# EasyEDA Pro project ProPrj_PWR-1_2025-04-17.epro

# Schematic Schematic_1

## Sheets
1 P1: Board Name: Board_1; Create Date: 2025-04-08; Page Name: P1; Project Name: PWR-1; Schematic Name: Schematic_1; Update Date: 2025-04-08; Company: EasyEDA.com; Drawed: EasyEDA Pro; Page Size: A3; Part Number: JLCPCB-001; Reviewed: EasyEDA Pro; Version: V0.1
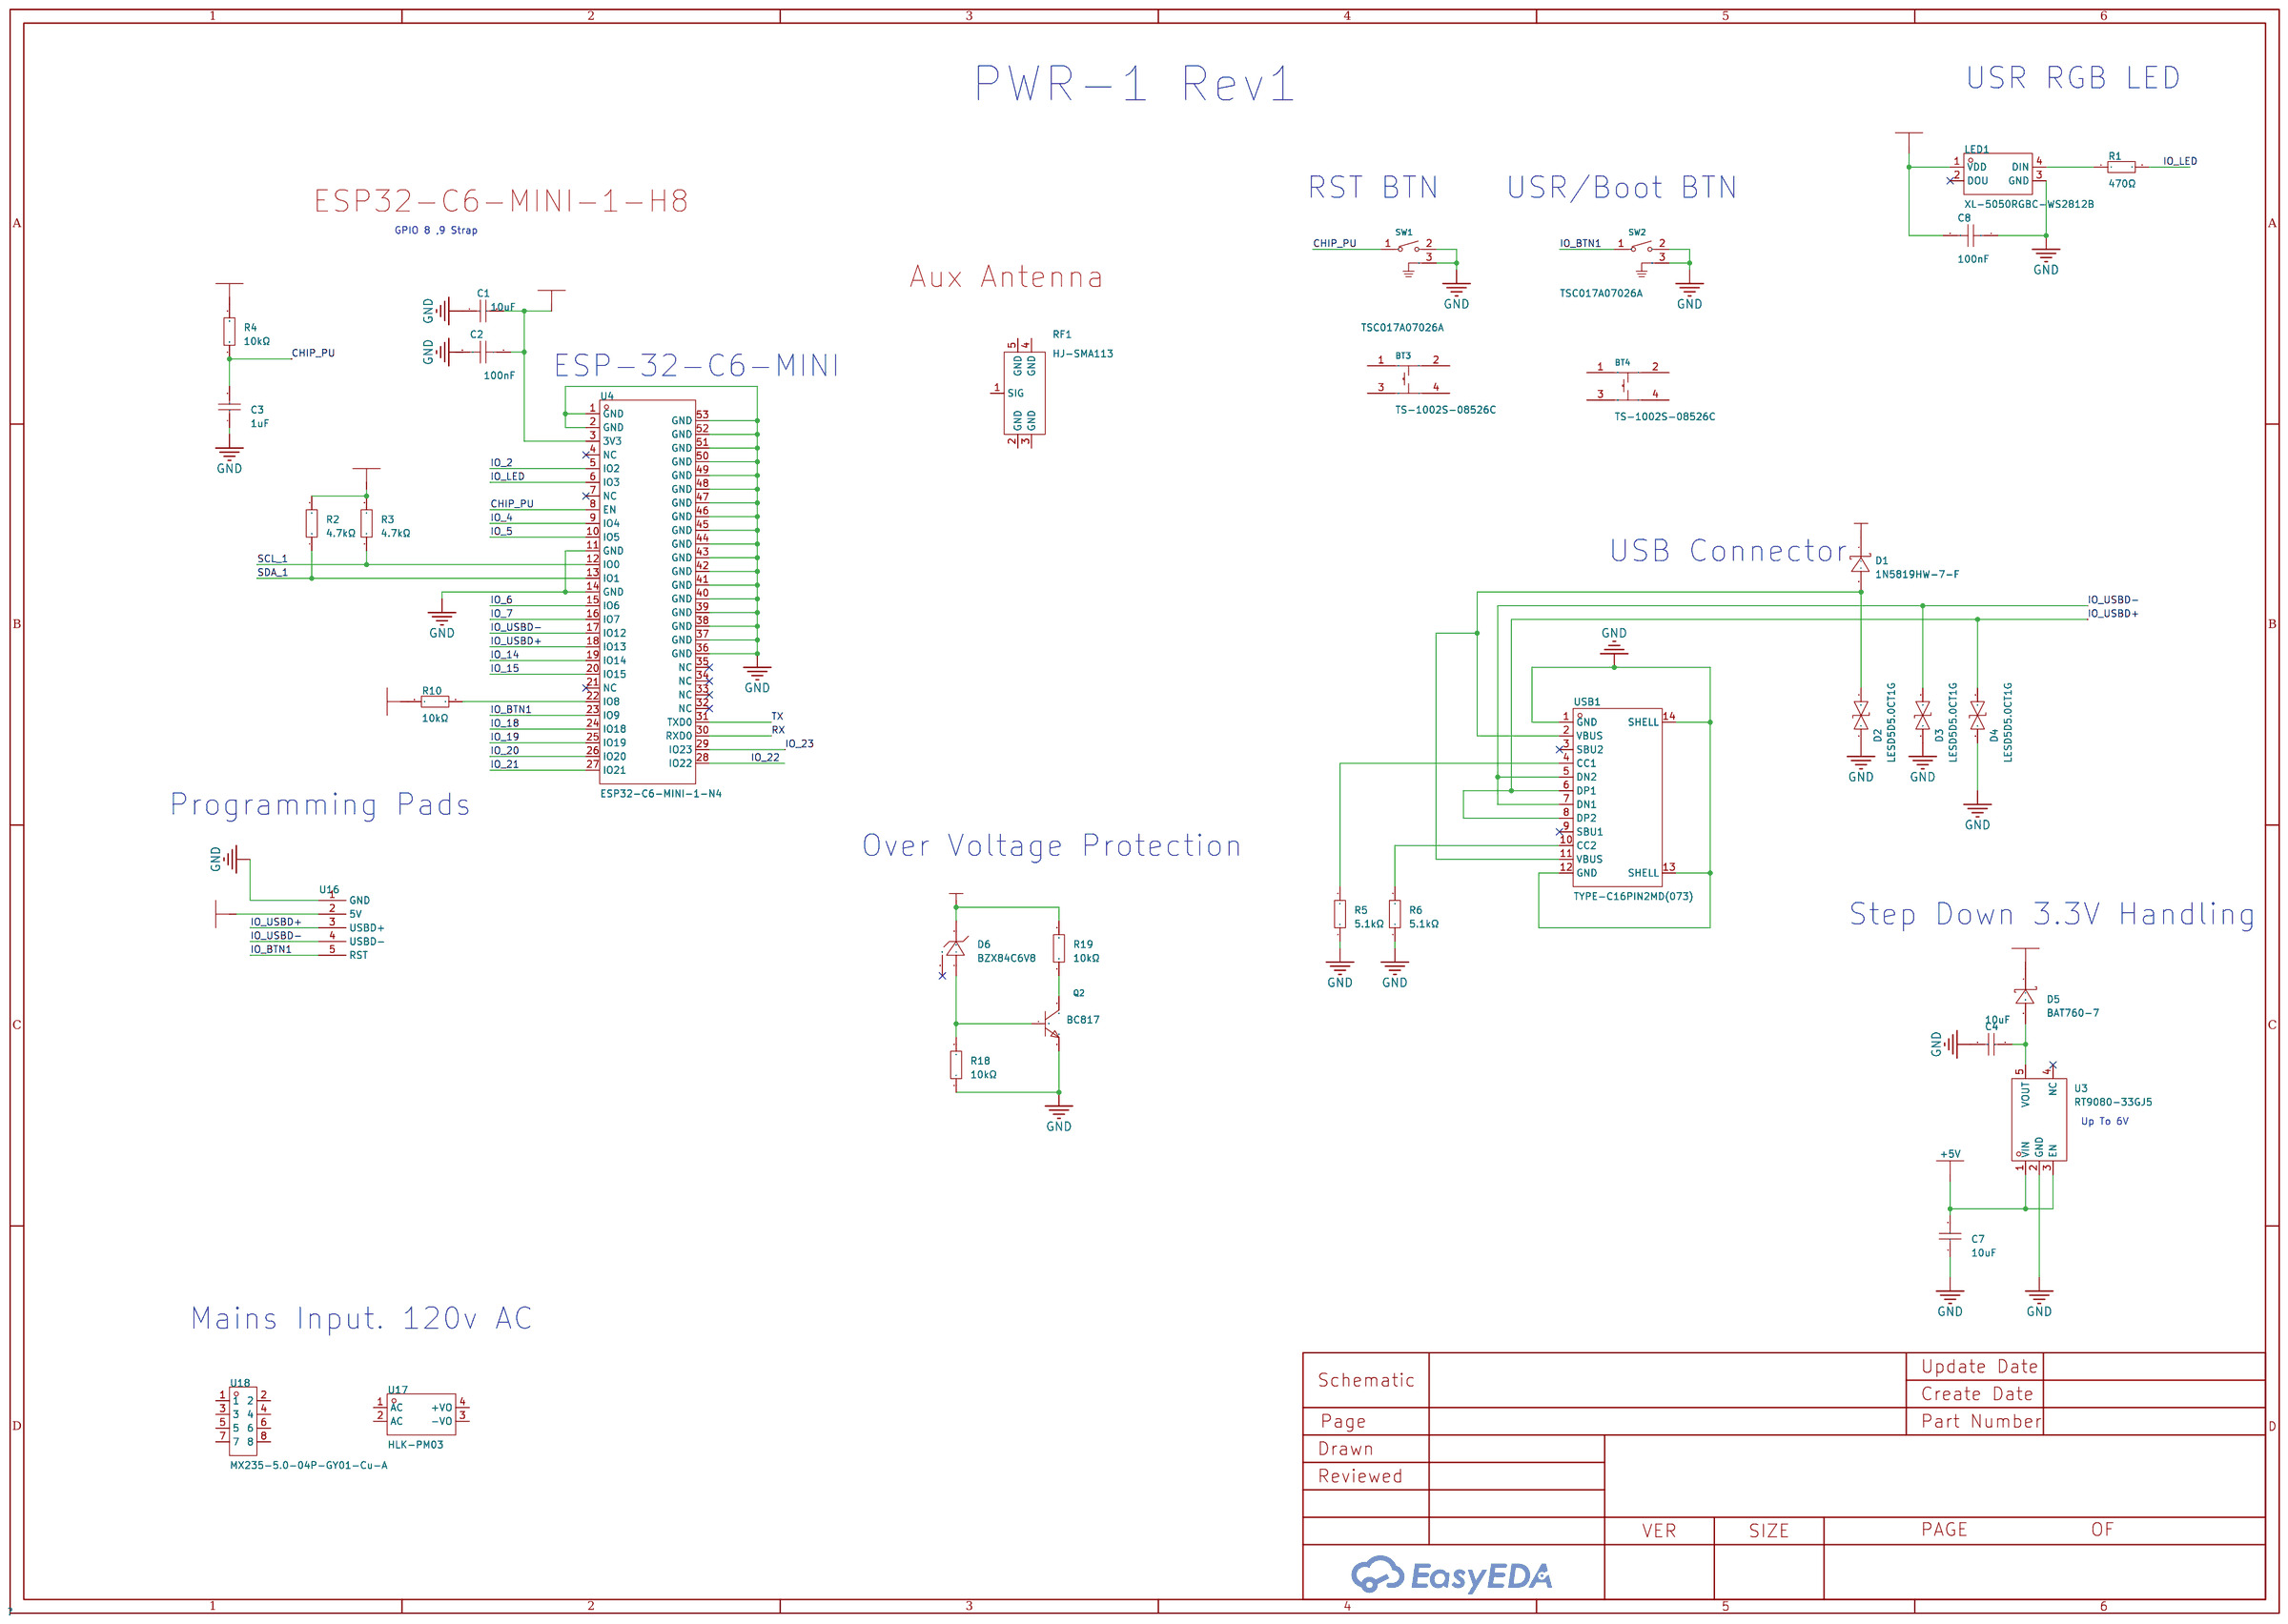
[diagram p0: P1]
2 P2: Page Name: P2
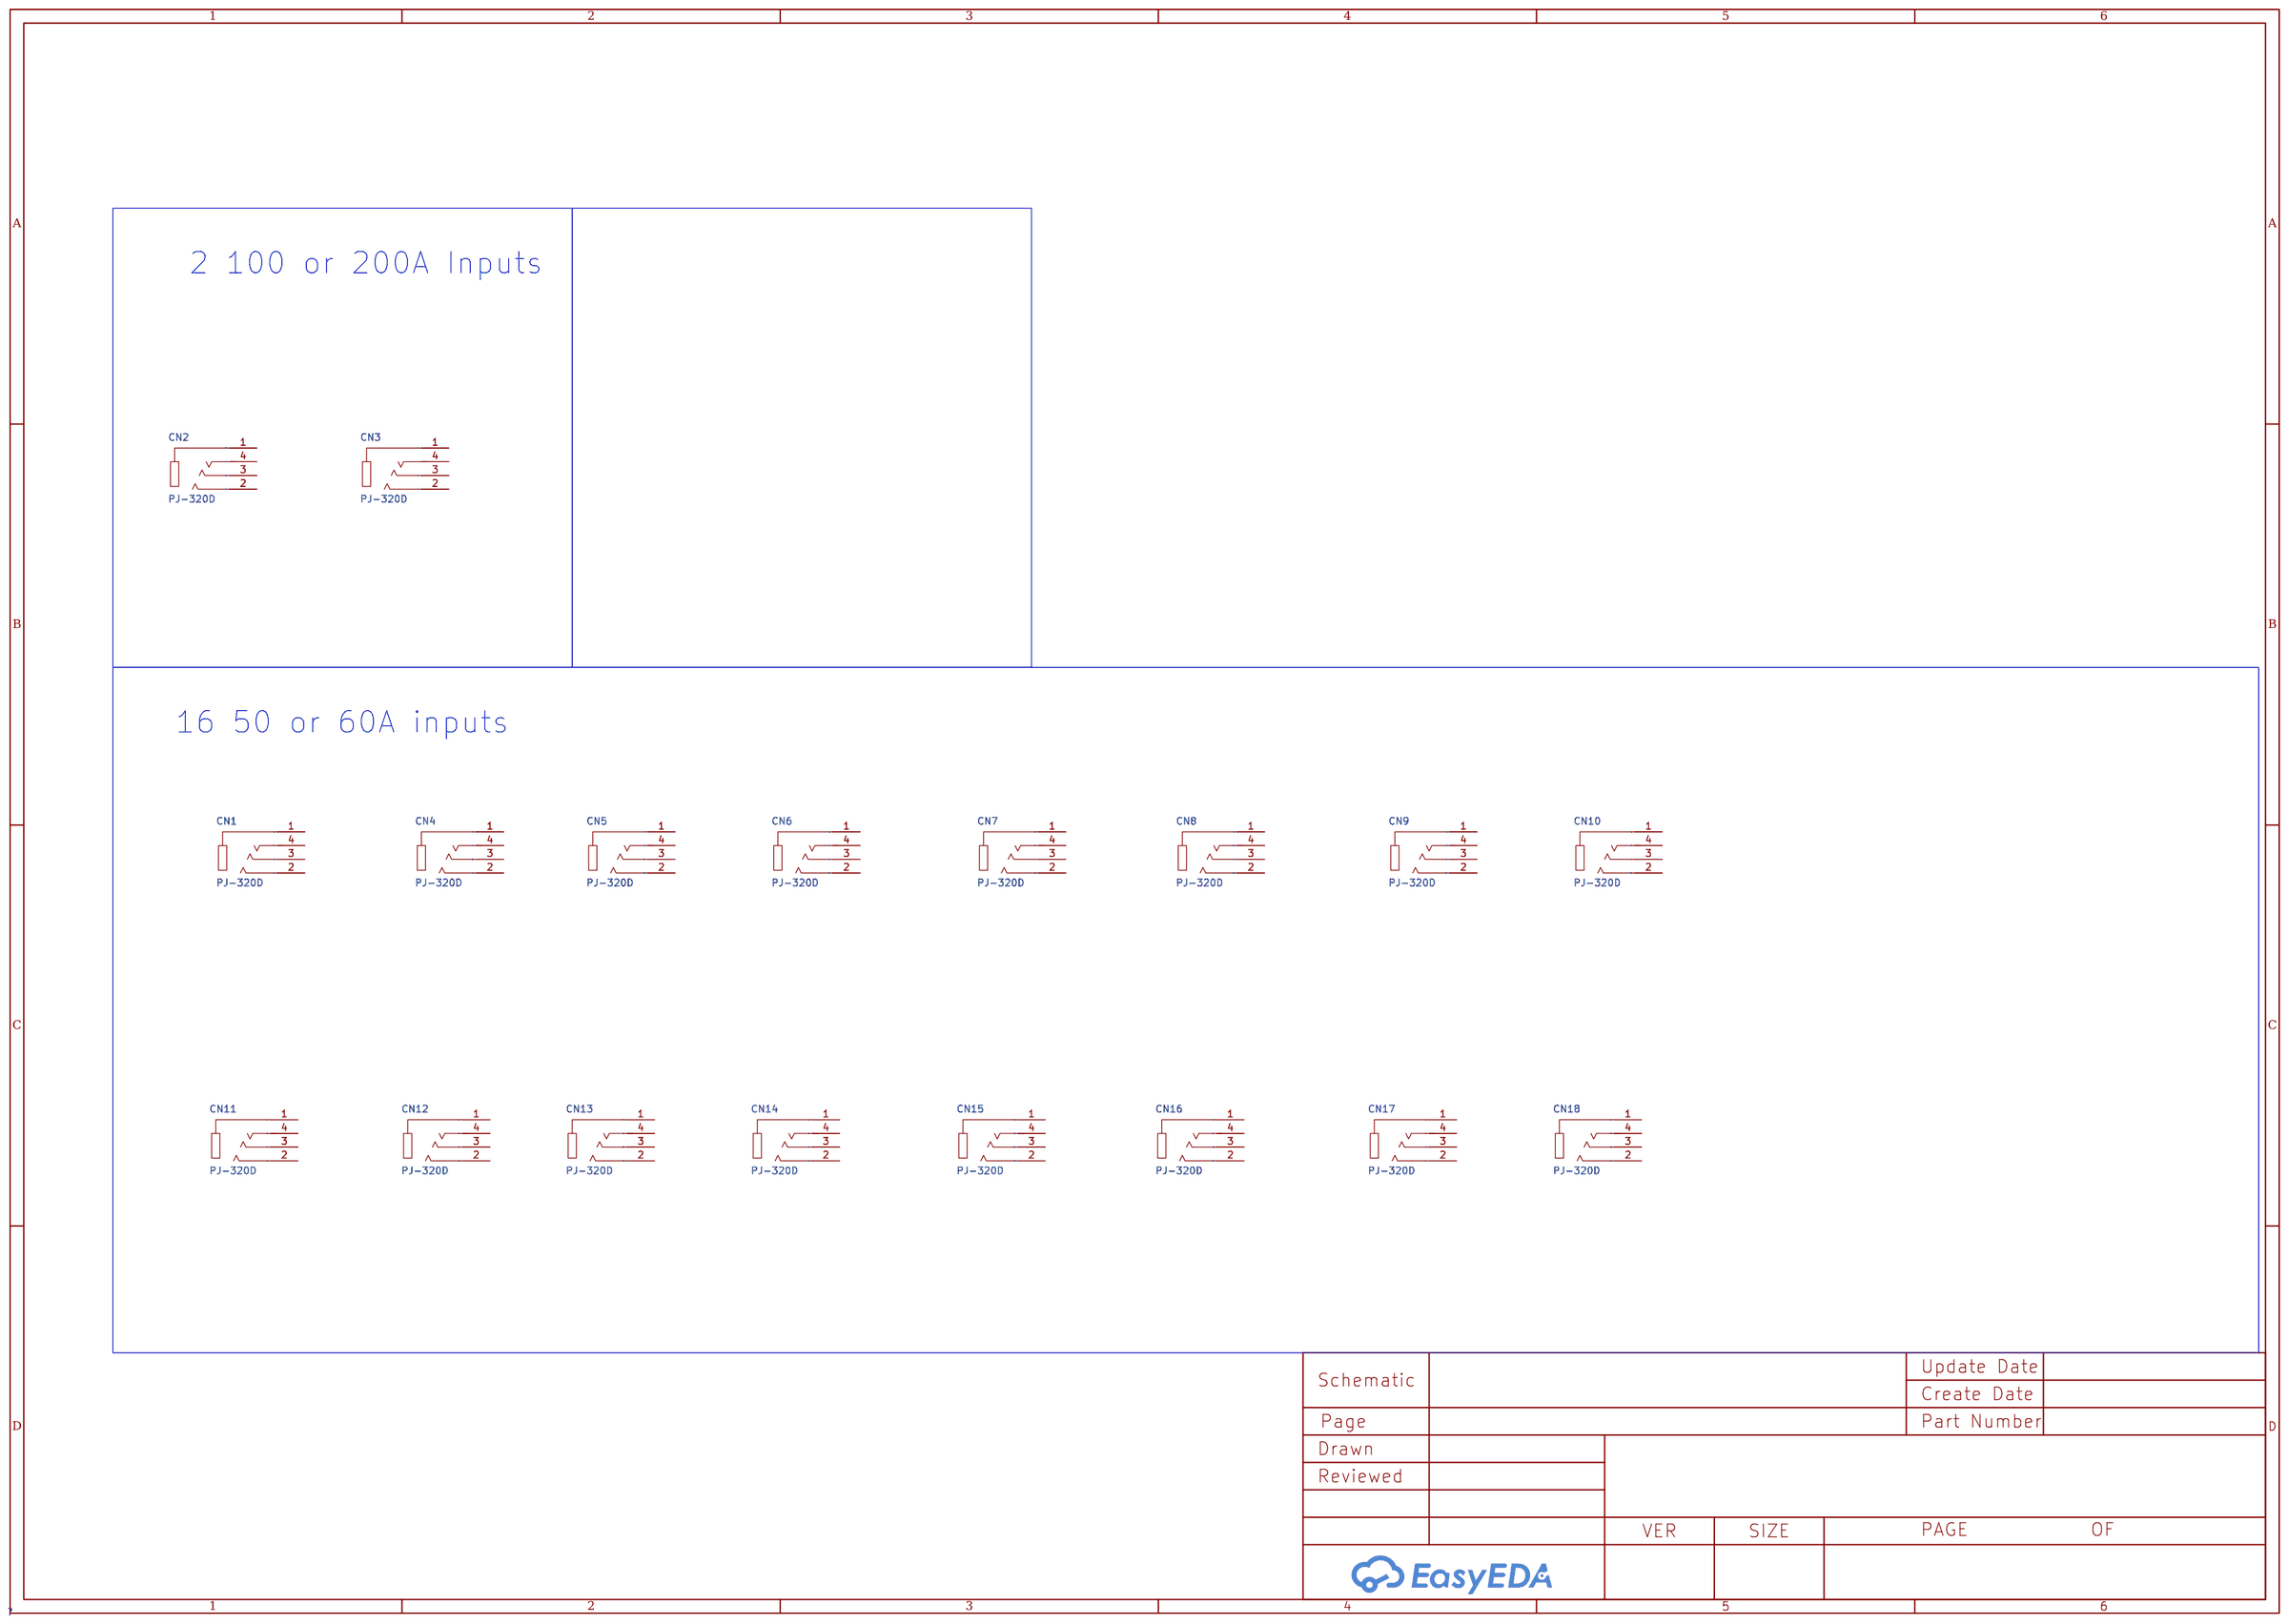
[diagram p1: P2]

## Parts
sheet P1
BT3  TS-1002S-08526C  [KEY-SMD_4P-L6.0-W6.0-P4.50-LS9.5-BR]
BT4  TS-1002S-08526C  [KEY-SMD_4P-L6.0-W6.0-P4.50-LS9.5-BR]
C1  10uF  [C0402]
C2  100nF  [C0402]
C3  1uF  [C0402]
C4  10uF  [C0402]
C7  10uF  [C0402]
C8  100nF  [C0402]
D1  1N5819HW-7-F  [SOD-123_L2.7-W1.6-LS3.7-RD]
D2  LESD5D5.0CT1G  [SOD-523_L1.2-W0.8-LS1.6-BI]
D3  LESD5D5.0CT1G  [SOD-523_L1.2-W0.8-LS1.6-BI]
D4  LESD5D5.0CT1G  [SOD-523_L1.2-W0.8-LS1.6-BI]
D5  BAT760-7  [SOD-323_L1.8-W1.3-LS2.5-RD]
D6  BZX84C6V8  [SOT-23_L2.9-W1.3-P1.90-LS2.4-BR]
LED1  XL-5050RGBC-WS2812B  [LED-SMD_4P-L5.0-W5.0-BL_XL-5050RGBC]
Q2  BC817  [SOT-23-3_L2.9-W1.4-P1.91-LS2.6-BR]
R1  470Ω  [R0402]
R2  4.7kΩ  [R0402]
R3  4.7kΩ  [R0402]
R4  10kΩ  [R0402]
R5  5.1kΩ  [R0402]
R6  5.1kΩ  [R0402]
R10  10kΩ  [R0402]
R18  10kΩ  [R0603]
R19  10kΩ  [R0603]
RF1  HJ-SMA113  [SMA-TH_HJ-SMA113]
SW1  TSC017A07026A  [SW-TH_3P-L4.5-W7.0-P3.00-LS1.9]
SW2  TSC017A07026A  [SW-TH_3P-L4.5-W7.0-P3.00-LS1.9]
U3  RT9080-33GJ5  [TSOT-23-5_L2.9-W1.6-P0.95-LS2.8-BL]
U4  ESP32-C6-MINI-1-N4  [WIFIM-SMD_61P-L16.6-W13.2-P0.80-ESP32-C6-MINI-1-N4]
U16  -  [Programming Pads]
U17  HLK-PM03  [PWRM-TH_HLK-PM03]
U18  MX235-5.0-04P-GY01-Cu-A  [CONN-TH_8P-P5.00_MAX_MX235-5.0-GY01-04P-CU-A]
USB1  TYPE-C16PIN2MD(073)  [USB-C-SMD_TYPE-C-6PIN-2MD-073]
sheet P2
CN1  PJ-320D  [AUDIO-SMD_PJ-320D]
CN2  PJ-320D  [AUDIO-SMD_PJ-320D]
CN3  PJ-320D  [AUDIO-SMD_PJ-320D]
CN4  PJ-320D  [AUDIO-SMD_PJ-320D]
CN5  PJ-320D  [AUDIO-SMD_PJ-320D]
CN6  PJ-320D  [AUDIO-SMD_PJ-320D]
CN7  PJ-320D  [AUDIO-SMD_PJ-320D]
CN8  PJ-320D  [AUDIO-SMD_PJ-320D]
CN9  PJ-320D  [AUDIO-SMD_PJ-320D]
CN10  PJ-320D  [AUDIO-SMD_PJ-320D]
CN11  PJ-320D  [AUDIO-SMD_PJ-320D]
CN12  PJ-320D  [AUDIO-SMD_PJ-320D]
CN13  PJ-320D  [AUDIO-SMD_PJ-320D]
CN14  PJ-320D  [AUDIO-SMD_PJ-320D]
CN15  PJ-320D  [AUDIO-SMD_PJ-320D]
CN16  PJ-320D  [AUDIO-SMD_PJ-320D]
CN17  PJ-320D  [AUDIO-SMD_PJ-320D]
CN18  PJ-320D  [AUDIO-SMD_PJ-320D]

## Library data of the parts
BT3 BT4 = TS-1002S-08526C: Circuit:SPST Actuator Style:Round Button Mounting Style:Brick nogging Switch Length:6mm Switch Width:6mm Switch Height:8.5mm Contact Current:50mA Voltage Rating (DC):12V With Lamp:- Mechanical Life:-; LCSC Part Name: 6*6*8.5mm 立贴 轻触开关; Supplier Part: C455117; Manufacturer: XUNPU(讯普); Supplier Footprint: SMD,6x6mm; Datasheet: https://atta.szlcsc.com/upload/public/pdf/source/20191118/C455126_F61E8FA1ED640FB1CE0B30B55DEB62E3.pdf; Supplier: LCSC; Circuit: SPST; Actuator Style: Round Button; Mounting Style: Brick nogging; Switch Length: 6mm; Switch Width: 6mm; Switch Height: 8.5mm; Contact Current: 50mA; Voltage Rating (DC): 12V
C1 C4 = CL05A106MQ5NUNC: Capacitance: Tolerance:±20% Tolerance:±20% Voltage Rated: Temperature Coefficient:; LCSC Part Name: 10uF ±20% 6.3V; Supplier Part: C15525; Manufacturer: SAMSUNG(三星); Supplier Footprint: 0402; JLCPCB Part Class: Basic Part; Datasheet: https://atta.szlcsc.com/upload/public/pdf/source/20220823/2B02EE04F8F211D38A52DCB16EB6BEBA.pdf; Supplier: LCSC; Tolerance: ±20%
C2 C8 = CL05B104KO5NNNC: Capacitance: Tolerance:±10% Tolerance:±10% Voltage Rated: Temperature Coefficient:; LCSC Part Name: 100nF ±10% 16V; Supplier Part: C1525; Manufacturer: SAMSUNG(三星); Supplier Footprint: 0402; JLCPCB Part Class: Basic Part; Datasheet: https://atta.szlcsc.com/upload/public/pdf/source/20160218/1457707763339.pdf; Supplier: LCSC; Tolerance: ±10%
C3 = CL05A105KP5NNNC: Capacitance: Tolerance:±10% Tolerance:±10% Voltage Rated: Temperature Coefficient:; LCSC Part Name: 1uF ±10% 10V; Supplier Part: C14445; Manufacturer: SAMSUNG(三星); Supplier Footprint: 0402; JLCPCB Part Class: Extended Part; Datasheet: https://atta.szlcsc.com/upload/public/pdf/source/20160218/1457707763339.pdf; Supplier: LCSC; Tolerance: ±10%
C7 = CL05A106MP5NUNC_C315248: Capacitance: Tolerance:±20% Tolerance:±20% Voltage Rated: Temperature Coefficient:; LCSC Part Name: 10uF ±20% 10V; Supplier Part: C315248; Manufacturer: SAMSUNG(三星); Manufacturer Part: CL05A106MP5NUNC; Supplier Footprint: 0402; JLCPCB Part Class: Extended Part; Datasheet: https://atta.szlcsc.com/upload/public/pdf/source/20160218/1457707763339.pdf; Supplier: LCSC; Tolerance: ±20%
D1 = 1N5819HW-7-F: Reverse Voltage (Vr):40V Average Rectified Current (Io):1A Forward Voltage (Vf@If):450mV@1A; LCSC Part Name: 40V1A450mV@1A; Supplier Part: C82544; Manufacturer: DIODES(美台); Supplier Footprint: SOD-123; JLCPCB Part Class: ExtendedPart; Datasheet: https://atta.szlcsc.com/upload/public/pdf/source/20161024/1477288459223.pdf; Supplier: LCSC; Reverse Voltage (Vr): 40V; Average Rectified Current (Io): 1A; Forward Voltage (Vf@If): 450mV@1A
D2-D4 = LESD5D5.0CT1G: Polarity:Bi-Directional Reverse Stand-Off Voltage (Vrwm):5V Breakdown Voltage (VBR):5.6V Peak Pulse Current(Ipp)@8/20us:9.4A Clamping Voltage@Ipp:18.6V; LCSC Part Name: 双向ESD; Supplier Part: C383211; Manufacturer: LRC(乐山无线电); Supplier Footprint: SOD-523; JLCPCB Part Class: ExtendedPart; Datasheet: https://atta.szlcsc.com/upload/public/pdf/source/20190807/C383211_633DF4B4E2C161403226E5235FE33A1C.pdf; Supplier: LCSC; Polarity: Bi-Directional; Reverse Stand-Off Voltage (Vrwm): 5V; Breakdown Voltage (VBR): 5.6V; Peak Pulse Current(Ipp)@8/20us: 9.4A; Clamping Voltage@Ipp: 18.6V
D5 = BAT760-7: Reverse Voltage (Vr):30V Average Rectified Current (Io):1A Forward Voltage (Vf@If):550mV@1A; LCSC Part Name: 30V1A550mV@1A; Supplier Part: C124187; Manufacturer: DIODES(美台); Supplier Footprint: SOD-323; JLCPCB Part Class: ExtendedPart; Datasheet: https://atta.szlcsc.com/upload/public/pdf/source/20171023/C124187_15087452555971052319.pdf; Supplier: LCSC; Reverse Voltage (Vr): 30V; Average Rectified Current (Io): 1A; Forward Voltage (Vf@If): 550mV@1A
D6 = BZX84C6V8_C118571: Diode Configuration:Single Zener Voltage (Nom):6.8V Reverse Leakage Current (Ir):2uA@4V Zener Voltage (Range):6.4V~7.2V Zener Voltage (Range):6.4V~7.2V Power Dissipation:350mW Zener Impedance (Zzt):15Ω Tolerance:- Tolerance:-; Supplier Part: C118571; Manufacturer: ST(先科); Supplier Footprint: SOT-23; JLCPCB Part Class: Extended Part; Datasheet: https://atta.szlcsc.com/upload/public/pdf/source/20170719/C118596_1500457750670828303.pdf; Supplier: LCSC; Diode Configuration: Single; Zener Voltage (Nom): 6.8V; Reverse Leakage Current (Ir): 2uA@4V; Zener Voltage (Range): 6.4V~7.2V; Power Dissipation: 350mW; Zener Impedance (Zzt): 15Ω
LED1 = XL-5050RGBC-WS2812B: Emitted Color:RGB Diode Configuration:- Lens Color:Colorless transparence Dominant Wavelength:- Dominant Wavelength:- Peak Wavelength:625nm；470nm；530nm Color Temperature:- Color Temperature:- Forward Current:- Power Dissipation:- Viewing Angle:120° Mounti; LCSC Part Name: RGB三色 正贴 幻彩; Supplier Part: C2843785; Manufacturer: XINGLIGHT(成兴光); Supplier Footprint: SMD5050; JLCPCB Part Class: Extended Part; Datasheet: https://atta.szlcsc.com/upload/public/pdf/source/20230111/86AAD2096485A2E5BCAB883FF8CBE6FD.pdf; Supplier: LCSC; Emitted Color: RGB; Lens Color: Colorless transparence; Peak Wavelength: 625nm；470nm；530nm; Viewing Angle: 120°; Mounting Sytle: Positive post; Operating Temperature: -30℃~+70℃
Q2 = BC817: Transistor Type: Collector Current (Ic): Collector-Emitter Breakdown Voltage (Vceo): Power Dissipation (Pd): Transition Frequency (fT):100MHz Collector Cut-Off Current (Icbo):100nA Collector-Emitter Saturation Voltage (VCE(sat)@Ic,Ib):700mV@500mA,50mA Ope; LCSC Part Name: NPN 电流:500mA 耐压:45V; Supplier Part: C466643; Manufacturer: High Diode(海德); Supplier Footprint: SOT-23; JLCPCB Part Class: 扩展库; Datasheet: https://atta.szlcsc.com/upload/public/pdf/source/20191203/C466643_48783E87EF98B3225D10B7DDEC5B406B.pdf; Supplier: LCSC; Transition Frequency (fT): 100MHz; Collector Cut-Off Current (Icbo): 100nA; Collector-Emitter Saturation Voltage (VCE(sat)@Ic,Ib): 700mV@500mA,50mA
R1 = 0402WGF4700TCE: Resistance: Tolerance:±1% Tolerance:±1% Power(Watts): Overload Voltage (Max): Temperature Coefficient:±100ppm/℃ Temperature Coefficient:±100ppm/℃ Type:Thick Film Resistors Operating Temperature Range:-55℃~+155℃ Operating Temperature Range:-55℃~+155℃; LCSC Part Name: 470Ω ±1% 62.5mW 厚膜电阻; Supplier Part: C25117; Manufacturer: UNI-ROYAL(厚声); Supplier Footprint: 0402; JLCPCB Part Class: Basic Part; Datasheet: https://atta.szlcsc.com/upload/public/pdf/source/20200306/C422600_1E6D84923E4A46A82E41ADD87F860B5C.pdf; Supplier: LCSC; Tolerance: ±1%; Temperature Coefficient: ±100ppm/℃; Type: Thick Film Resistors; Operating Temperature Range: -55℃~+155℃
R2 R3 = 0402WGF4701TCE: Resistance:4700Ω Tolerance:±1% Tolerance:±1% Power(Watts): Overload Voltage (Max): Temperature Coefficient:±100ppm/℃ Temperature Coefficient:±100ppm/℃ Type:Thick Film Resistors Operating Temperature Range:-55℃~+155℃ Operating Temperature Range:-55℃~+155℃; LCSC Part Name: 4.7kΩ ±1% 62.5mW 厚膜电阻; Supplier Part: C25900; Manufacturer: UNI-ROYAL(厚声); Supplier Footprint: 0402; JLCPCB Part Class: Basic Part; Datasheet: https://atta.szlcsc.com/upload/public/pdf/source/20200306/C422600_1E6D84923E4A46A82E41ADD87F860B5C.pdf; Supplier: LCSC; Tolerance: ±1%; Temperature Coefficient: ±100ppm/℃; Type: Thick Film Resistors; Operating Temperature Range: -55℃~+155℃
R4 R10 = 0402WGF1002TCE: Resistance:10000Ω Tolerance:±1% Tolerance:±1% Power(Watts): Overload Voltage (Max): Temperature Coefficient:±100ppm/℃ Temperature Coefficient:±100ppm/℃ Type:Thick Film Resistors Operating Temperature Range:-55℃~+155℃ Operating Temperature Range:-55℃~+155℃; LCSC Part Name: 10kΩ ±1% 62.5mW 厚膜电阻; Supplier Part: C25744; Manufacturer: UNI-ROYAL(厚声); Supplier Footprint: 0402; JLCPCB Part Class: Basic Part; Datasheet: https://atta.szlcsc.com/upload/public/pdf/source/20200306/C422600_1E6D84923E4A46A82E41ADD87F860B5C.pdf; Supplier: LCSC; Tolerance: ±1%; Temperature Coefficient: ±100ppm/℃; Type: Thick Film Resistors; Operating Temperature Range: -55℃~+155℃
R5 R6 = 0402WGF5101TCE: Resistance:5100Ω Tolerance:±1% Tolerance:±1% Power(Watts): Overload Voltage (Max): Temperature Coefficient:±100ppm/℃ Temperature Coefficient:±100ppm/℃ Type:Thick Film Resistors Operating Temperature Range:-55℃~+155℃ Operating Temperature Range:-55℃~+155℃; LCSC Part Name: 5.1kΩ ±1% 62.5mW 厚膜电阻; Supplier Part: C25905; Manufacturer: UNI-ROYAL(厚声); Supplier Footprint: 0402; JLCPCB Part Class: Basic Part; Datasheet: https://atta.szlcsc.com/upload/public/pdf/source/20200306/C422600_1E6D84923E4A46A82E41ADD87F860B5C.pdf; Supplier: LCSC; Tolerance: ±1%; Temperature Coefficient: ±100ppm/℃; Type: Thick Film Resistors; Operating Temperature Range: -55℃~+155℃
R18 R19 = 0603WAF1002T5E: Type:Thick Film Resistors Resistance:10kΩ Tolerance:±1% Tolerance:±1% Power(Watts): Overload Voltage (Max): Temperature Coefficient:±100ppm/℃ Temperature Coefficient:±100ppm/℃ Operating Temperature Range:-55℃~+155℃ Operating Temperature Range:-55℃~+155℃; LCSC Part Name: 厚膜电阻 10kΩ ±1% 100mW; Supplier Part: C25804; Manufacturer: UNI-ROYAL(厚声); Supplier Footprint: 0603; JLCPCB Part Class: Basic Part; Datasheet: https://atta.szlcsc.com/upload/public/pdf/source/20200306/C422600_1E6D84923E4A46A82E41ADD87F860B5C.pdf; Supplier: LCSC; Type: Thick Film Resistors; Tolerance: ±1%; Temperature Coefficient: ±100ppm/℃; Operating Temperature Range: -55℃~+155℃
RF1 = HJ-SMA113: Connector Type:板端 Interface Type:内针 Number of Ports:1 Interface Diameter:5.35mm Interface Length/Height:9.9mm Frequency-Max:- RF Series:RP-SMA Impedance:- Style:弯头 Operating Temperature Range:- Operating Temperature Range:-; LCSC Part Name: RP-SMA 内针 弯头; Supplier Part: C1509224; Manufacturer: 皇捷; Supplier Footprint: 插件; JLCPCB Part Class: Extended Part; Datasheet: https://atta.szlcsc.com/upload/public/pdf/source/20201224/C1509225_8F53365A19A4B62BC12E2BB264AD5D09.pdf; Supplier: LCSC; Connector Type: 板端; Interface Type: 内针; Number of Ports: 1; Interface Diameter: 5.35mm; Interface Length/Height: 9.9mm; RF Series: RP-SMA; Style: 弯头
SW1 SW2 = TSC017A07026A: Actuator Style:Round Button Operating Force:260gf Mounting Style:Lying Switch Length:4.5mm Switch Width:4.5mm Switch Height:7mm Contact Current:50mA Voltage Rating (AC):- Voltage Rating (DC):12V Mechanical Life:-; LCSC Part Name: 4.5*4.5*7mm 卧插 轻触开关; Supplier Part: C2888533; Manufacturer: BZCN(博众电气); Supplier Footprint: 插件; Datasheet: https://atta.szlcsc.com/upload/public/pdf/source/20210826/53484E62D1502C029467A3638274990F.pdf; Supplier: LCSC; Actuator Style: Round Button; Operating Force: 260gf; Mounting Style: Lying; Switch Length: 4.5mm; Switch Width: 4.5mm; Switch Height: 7mm; Contact Current: 50mA; Voltage Rating (DC): 12V
U3 = RT9080-33GJ5: Output Type:-; Supplier Part: C841192; Manufacturer: RICHTEK(台湾立锜); Supplier Footprint: TSOT-23-5; JLCPCB Part Class: ExtendedPart; Datasheet: https://atta.szlcsc.com/upload/public/pdf/source/20200918/C841192_D291BBB33AFC8816B317CCB22A728955.pdf; Supplier: LCSC
U4 = ESP32-C6-MINI-1-N4: Supplier Part: C5736265; Manufacturer: ESPRESSIF(乐鑫); Supplier Footprint: SMD-53P; JLCPCB Part Class: Extended Part; Datasheet: https://atta.szlcsc.com/upload/public/pdf/source/20240130/4529D418EFEC832950EB8101798FAED6.pdf; Supplier: LCSC
U16 = Programming Pad Comp
U17 = HLK-PM03: Conversion Type:AC-DC Input Voltage(DC):120V~350V Input Voltage(DC):120V~350V Output Voltage:3.3V Output Voltage:3.3V Output Power:3W Input Voltage(AC):90VAC~265VAC Input Voltage(AC):90VAC~265VAC Output Current (Max):1A Output Current (Max):1A Function:St; Supplier Part: C209904; Manufacturer: HI-LINK(海凌科); Supplier Footprint: 插件; Datasheet: https://atta.szlcsc.com/upload/public/pdf/source/20231009/A2CB2EF6B3F7CFD4452AD83E39216571.pdf; Supplier: LCSC; Conversion Type: AC-DC; Input Voltage(DC): 120V~350V; Output Voltage: 3.3V; Output Power: 3W; Input Voltage(AC): 90VAC~265VAC; Output Current (Max): 1A; Function: Step-down type; Output Channel: 1; Insulated Voltage: 3kV@AC; Conversion Efficiency: 72%; Feature: Overcurrent Protection；Short-Circuit Protection
U18 = MX235-5.0-04P-GY01-Cu-A: Structure:1x4P Pitch:5mm Color:Gray Mounting Style:Direct Insert Number of Pins:4P Number of PINs Per Row:4 Number of Rows:1 Current Rating (Max):10A Voltage Rating (Max):300V Wire Gauge - AWG:16~20 Wire Gauge - mm2:0.5~1.5 Operating Temperature Range:-40; LCSC Part Name: 1x4P 5mm 每排P数:4 排数:1; Supplier Part: C5349566; Manufacturer: MAX(迈旭); Supplier Footprint: 插件,P=5.0mm; Datasheet: https://atta.szlcsc.com/upload/public/pdf/source/20230914/C0DB67150FF86E24383A1FFFBCEE389F.pdf; Supplier: LCSC; Structure: 1x4P; Pitch: 5mm; Color: Gray; Mounting Style: Direct Insert; Number of Pins: 4P; Number of PINs Per Row: 4; Number of Rows: 1; Current Rating (Max): 10A; Voltage Rating (Max): 300V; Wire Gauge - AWG: 16~20; Wire Gauge - mm2: 0.5~1.5; Operating Temperature Range: -40℃~+105℃
USB1 = TYPE-C 16PIN 2MD(073): Connector Type:Type-C Standard:- Gender:Female Number of Contacts:16 Number of Ports:1 Mounting Style:Surface Mount Current Rating - Power (Max):5A Operating Temperature Range:-25℃~+85℃ Operating Temperature Range:-25℃~+85℃; LCSC Part Name: TYPE-C母座16P4脚插件带定位柱不锈钢外壳2次模顶; Supplier Part: C2765186; Manufacturer: SHOUHAN(首韩); Supplier Footprint: SMD; JLCPCB Part Class: ExtendedPart; Supplier: LCSC; Connector Type: Type-C; Gender: Female; Number of Contacts: 16; Number of Ports: 1; Mounting Style: SurfaceMount; Current Rating - Power (Max): 5A; Operating Temperature Range: -25℃~+85℃
CN1-CN18 = PJ-320D_C431535: Connector Type:3.5mm耳机座 Current Rating (Max):300mA Voltage Rating (Max):50V Operating Temperature Range:-16℃~+65℃ Operating Temperature Range:-16℃~+65℃; LCSC Part Name: 3.5mm耳机座; Supplier Part: C431535; Manufacturer: SHOU HAN(首韩); Supplier Footprint: SMD; JLCPCB Part Class: Extended Part; Datasheet: https://atta.szlcsc.com/upload/public/pdf/source/20190925/C431535_8B274506621F6117FB020BF07A197848.pdf; Supplier: LCSC; Connector Type: 3.5mm耳机座; Current Rating (Max): 300mA; Voltage Rating (Max): 50V; Operating Temperature Range: -16℃~+65℃

## Nets
+3V3: C1.2 C2.1 D5.1 R2.2 R3.2 R4.2 R10.2 U4.3(3V3)
+5V: C7.2 U3.1(VIN) U3.3(EN)
+5V_USB: C8.2 D1.1(K) D6.3(C) LED1.1(VDD) R19.2 U16.2(5V)
GND: C1.1 C2.2 C3.1 C4.1 C7.1 C8.1 D2.2 D3.2 D4.2 LED1.3(GND) Q2.2(E) R5.1 R6.1 R18.1 SW1.2 SW1.3 SW2.2 SW2.3 U3.2(GND) U4.1(GND) U4.2(GND) U4.11(GND) U4.14(GND) U4.36(GND) U4.37(GND) U4.38(GND) U4.39(GND) U4.40(GND) U4.41(GND) U4.42(GND) U4.43(GND) U4.44(GND) U4.45(GND) U4.46(GND) U4.47(GND) U4.48(GND) U4.49(GND) U4.50(GND) U4.51(GND) U4.52(GND) U4.53(GND) U16.1(GND) USB1.1(GND) USB1.12(GND) USB1.13(SHELL) USB1.14(SHELL)
CHIP_PU: C3.2 R4.1 SW1.1 U4.8(EN)
IO_2: U4.5(IO2)
IO_4: U4.9(IO4)
IO_5: U4.10(IO5)
IO_6: U4.15(IO6)
IO_7: U4.16(IO7)
IO_14: U4.19(IO14)
IO_15: U4.20(IO15)
IO_18: U4.24(IO18)
IO_19: U4.25(IO19)
IO_20: U4.26(IO20)
IO_21: U4.27(IO21)
IO_22: U4.28(IO22)
IO_23: U4.29(IO23)
IO_BTN1: SW2.1 U4.23(IO9) U16.5(RST)
IO_LED: R1.2 U4.6(IO3)
IO_USBD+: D4.1 U4.18(IO13) U16.3(USBD+) USB1.6(DP1) USB1.8(DP2)
IO_USBD-: D3.1 U4.17(IO12) U16.4(USBD-) USB1.5(DN2) USB1.7(DN1)
RX: U4.30(RXD0)
SCL_1: R3.1 U4.12(IO0)
SDA_1: R2.1 U4.13(IO1)
TX: U4.31(TXD0)
$1N1378: D1.2(A) D2.1 USB1.2(VBUS) USB1.11(VBUS)
$1N1381: R5.2 USB1.4(CC1)
$1N1382: R6.2 USB1.10(CC2)
$1N1386: C4.2 D5.2 U3.5(VOUT)
$1N1418: R10.1 U4.22(IO8)
$1N1653: Q2.3(C) R19.1
$1N1655: D6.1(A) Q2.1(B) R18.2
$1N2084: LED1.4(DIN) R1.1

Not connected (* = marked no-connect by the designer): BT3 1 2 3 4; BT4 1 2 3 4; CN1 1 2 3 4; CN2 1 2 3 4; CN3 1 2 3 4; CN4 1 2 3 4; CN5 1 2 3 4; CN6 1 2 3 4; CN7 1 2 3 4; CN8 1 2 3 4; CN9 1 2 3 4; CN10 1 2 3 4; CN11 1 2 3 4; CN12 1 2 3 4; CN13 1 2 3 4; CN14 1 2 3 4; CN15 1 2 3 4; CN16 1 2 3 4; CN17 1 2 3 4; CN18 1 2 3 4; D6 2*; LED1 2(DOU)*; RF1 1(SIG) 2(GND) 3(GND) 4(GND) 5(GND); U3 4(NC)*; U4 4(NC)* 7(NC)* 21(NC)* 32(NC)* 33(NC)* 34(NC)* 35(NC)*; U17 1(AC) 2(AC) 3(-VO) 4(+VO); U18 1 2 3 4 5 6 7 8; USB1 3(SBU2)* 9(SBU1)*

## Notes on the sheets
sheet 1
- USR RGB LED
- PWR-1 Rev1
- RST BTN
- USR/Boot BTN
- ESP32-C6-MINI-1-H8
- GPIO 8 ,9 Strap
- Aux Antenna
- ESP-32-C6-MINI
- USB Connector
- Programming Pads
- Over Voltage Protection
- Step Down 3.3V Handling
- Up To 6V
- Mains Input. 120v AC
sheet 2
- 2 100 or 200A Inputs
- 16 50 or 60A inputs

# Board PCB_1
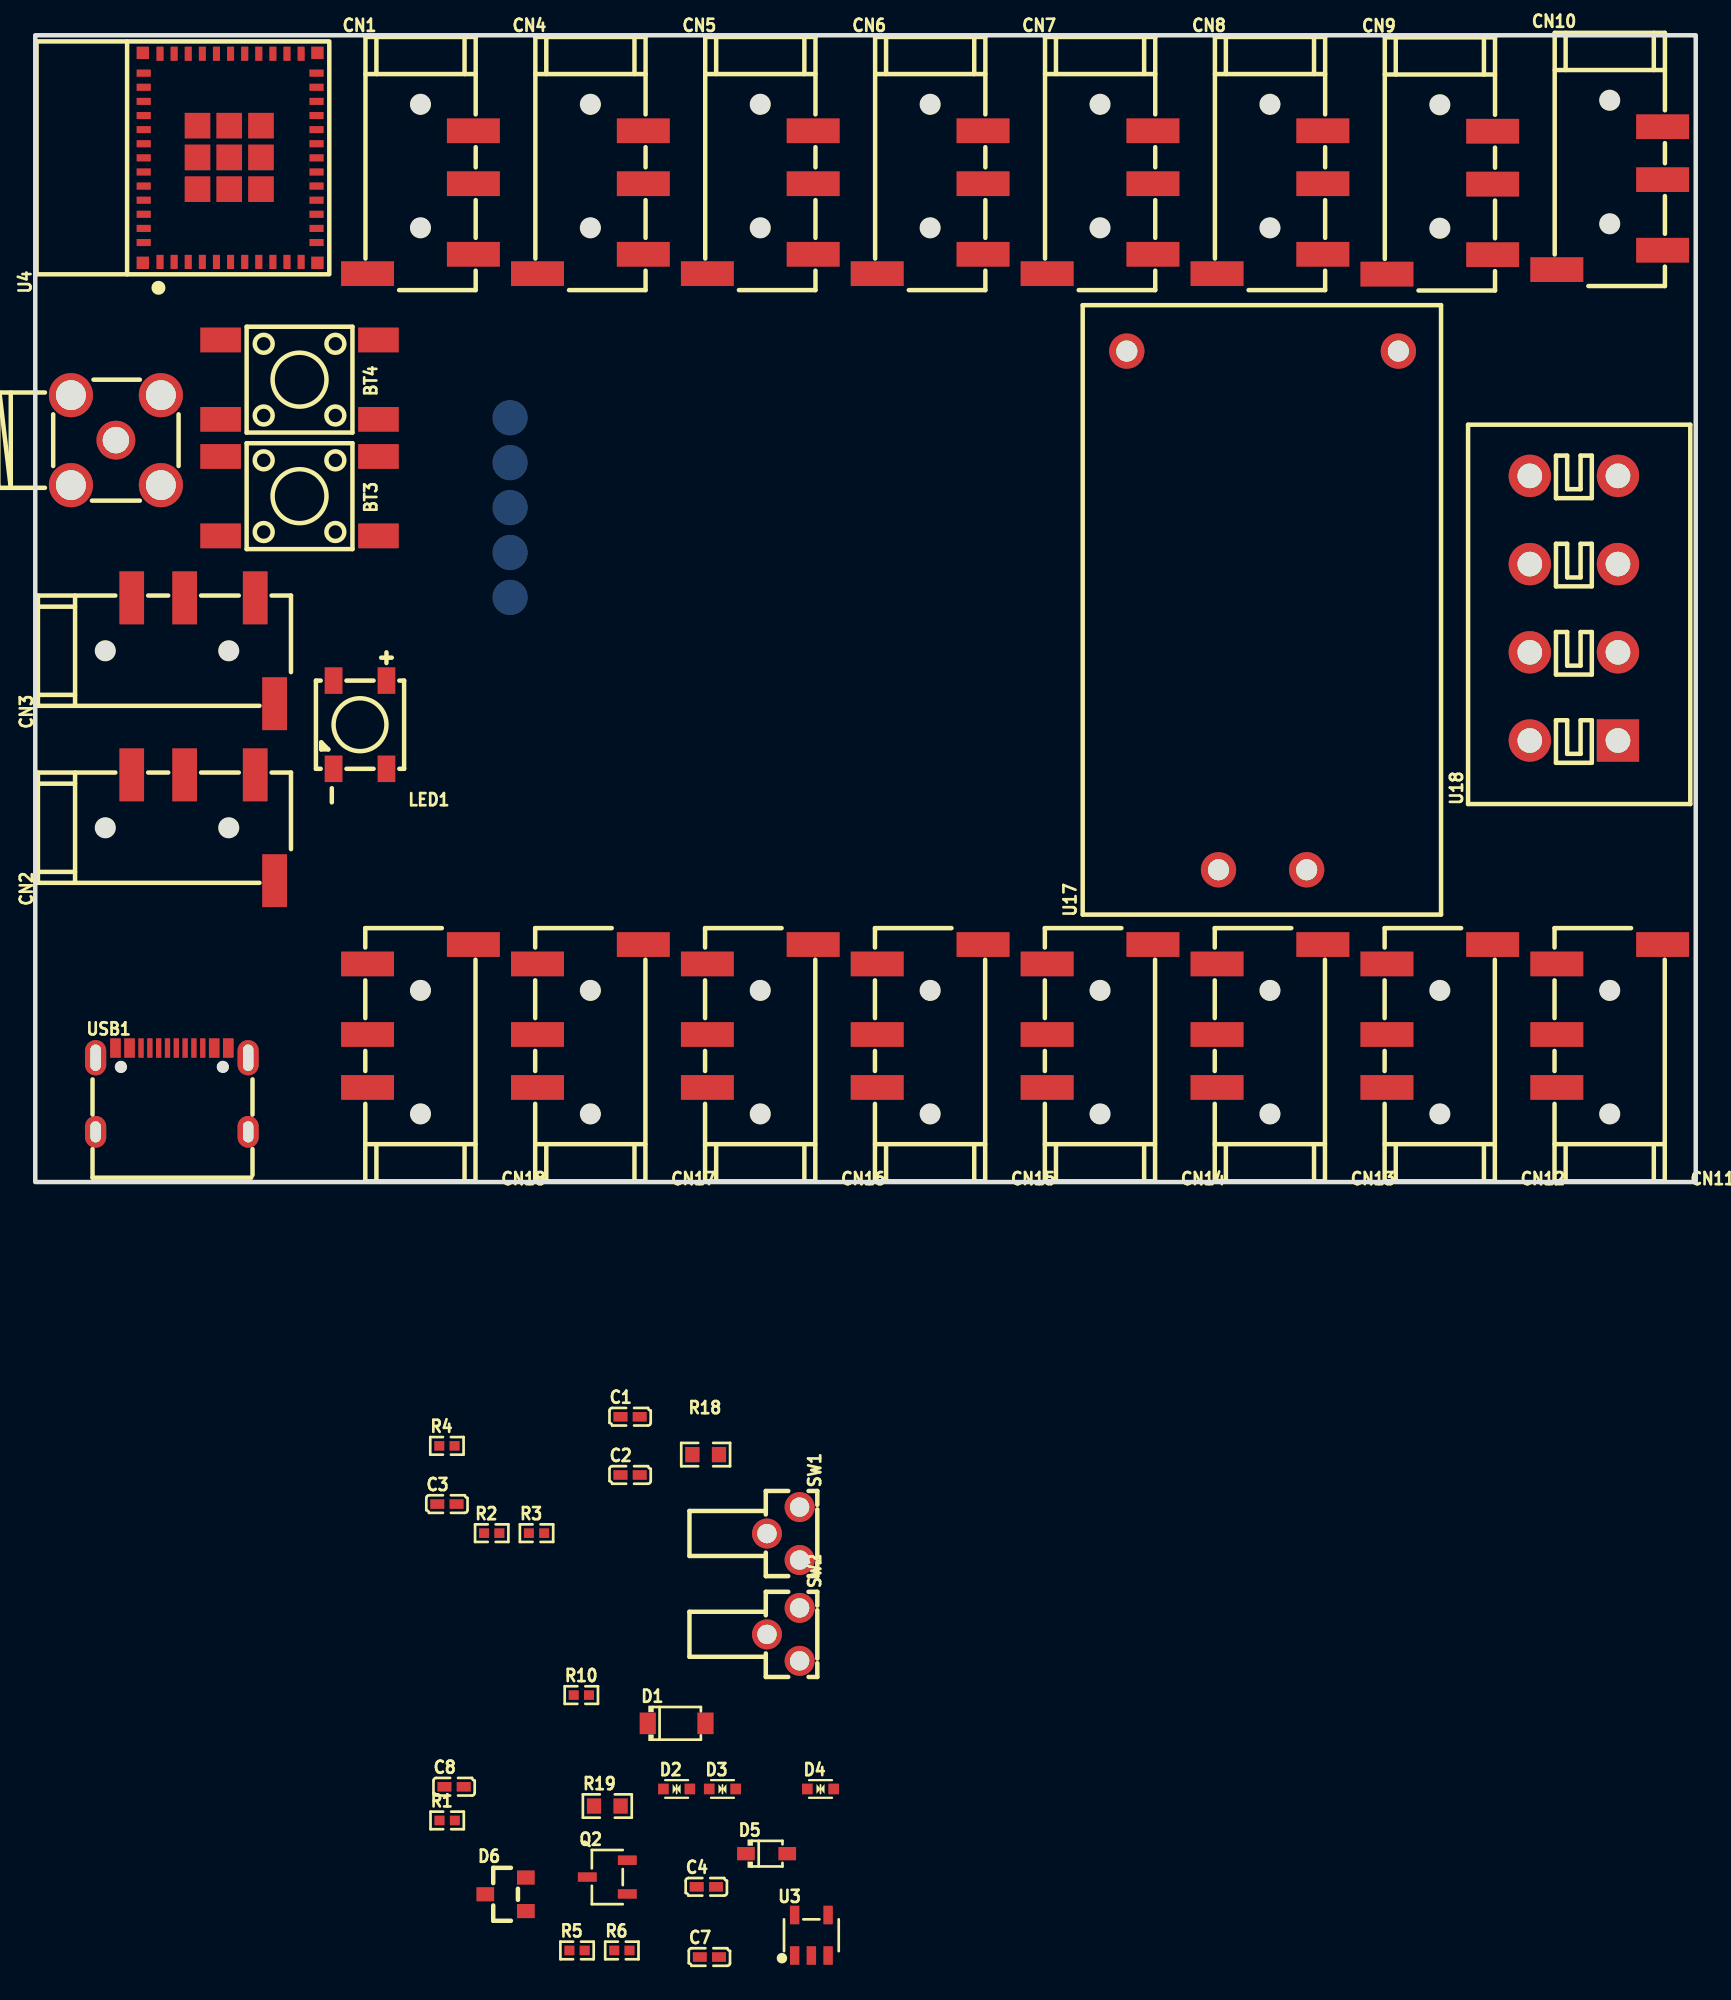
[diagram p2: board, top side]
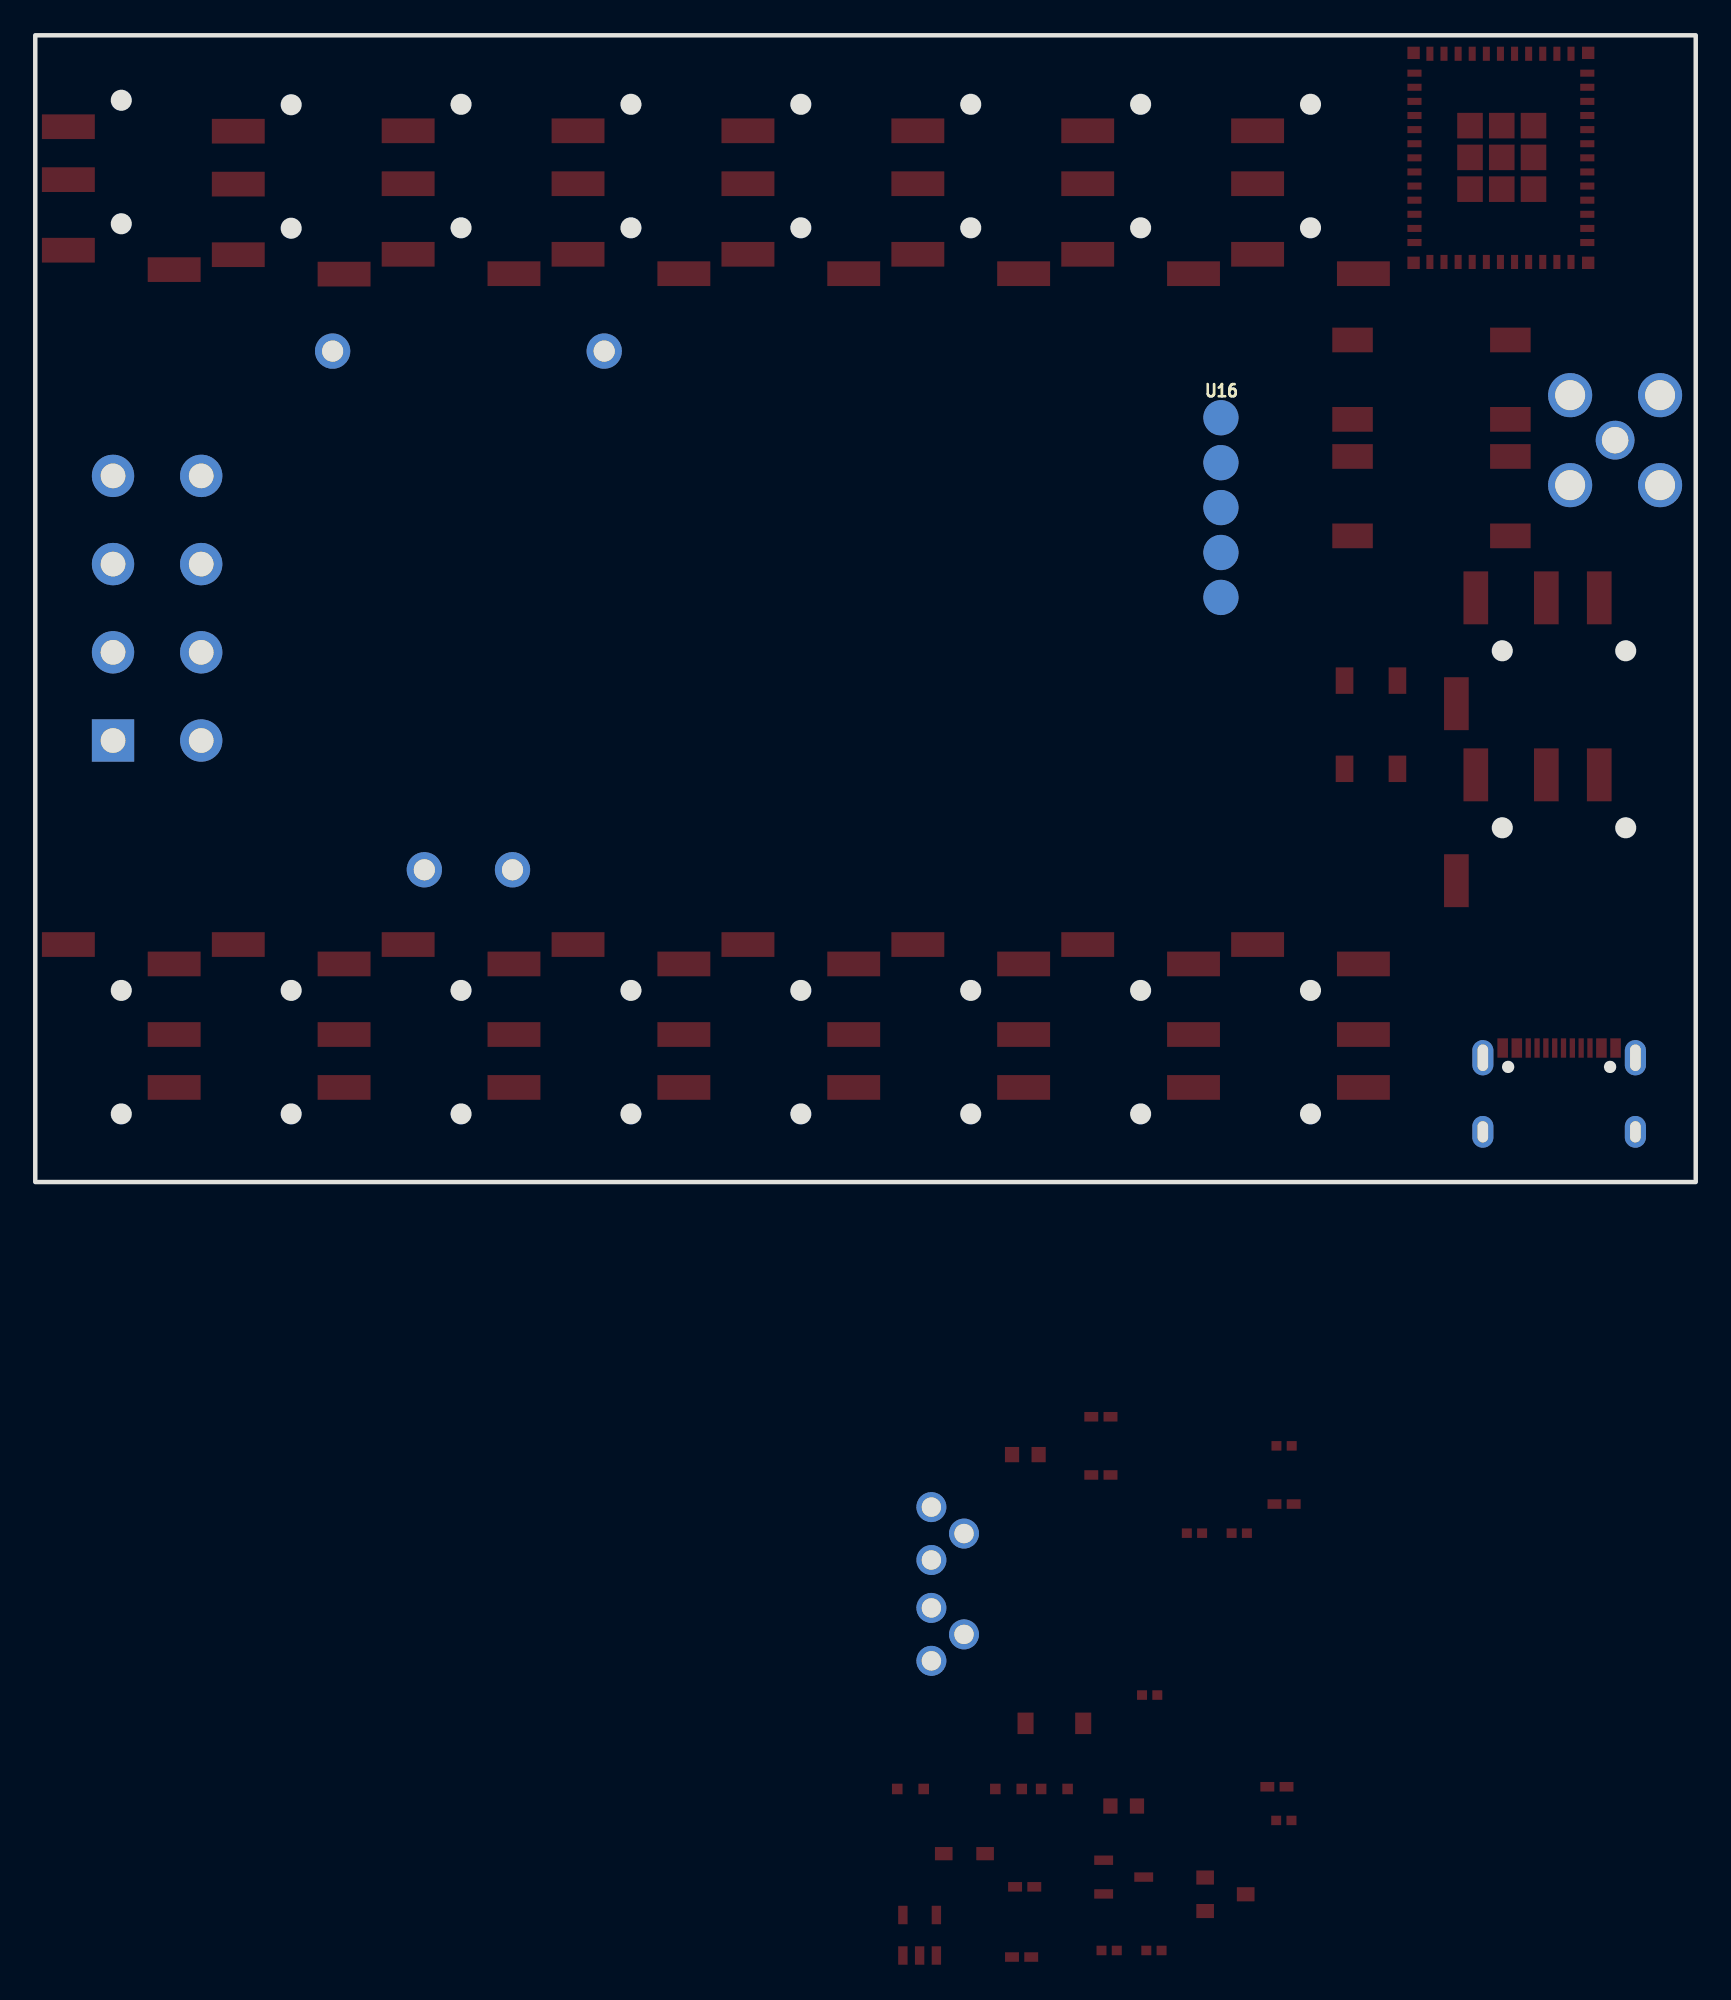
[diagram p3: board, bottom side, seen from below]

Outline 94.16 x 65 mm; copper layers: Top Layer, Bottom Layer. Coordinates in mm from the lower left corner of the outline.
Outline path: rectangle 0,65 94.16,0
Stack: Top Layer 0.035mm / Dielectric1 1.51mm FR4 er 4.5 / Bottom Layer 0.035mm

## Design rules (mm)
template: JLCPCB Capability(Two Layers Board)
spacing copperThickness1oz (default): track to track 0.102, other pairs 0.152 to 0.3
spacing copperThickness2oz: track to track 0.203, other pairs 0.152 to 0.3
track width copperThickness1oz (default): min 0.127, default 0.254, max 2.54
track width copperThickness2oz: min 0.203, default 0.254, max 2.54
differential pair differentialPair (default): width min 0.127, default 0.254, max 2.54; gap min 0.152, default 0.152
via viaSize (default): diameter min 0.5, default 0.61, max 10; hole min 0.3, default 0.305, max 6.3

## Placement (name value [footprint] x y rotation side)
BT3  TS-1002S-08526C  [KEY-SMD_4P-L6.0-W6.0-P4.50-LS9.5-BR]  14.99 38.88 180 top
BT4  TS-1002S-08526C  [KEY-SMD_4P-L6.0-W6.0-P4.50-LS9.5-BR]  14.99 45.48 180 top
C1  10uF  [C0402]  33.73 -13.3 0 top
C2  100nF  [C0402]  33.73 -16.6 0 top
C3  1uF  [C0402]  23.34 -18.25 0 top
C4  10uF  [C0402]  38.05 -39.95 0 top
C7  10uF  [C0402]  38.23 -43.93 0 top
C8  100nF  [C0402]  23.75 -34.28 0 top
CN1  PJ-320D  [AUDIO-SMD_PJ-320D]  21.84 55.54 0 top
CN2  PJ-320D  [AUDIO-SMD_PJ-320D]  9.52 20.08 90 top
CN3  PJ-320D  [AUDIO-SMD_PJ-320D]  9.52 30.11 90 top
CN4  PJ-320D  [AUDIO-SMD_PJ-320D]  31.48 55.54 0 top
CN5  PJ-320D  [AUDIO-SMD_PJ-320D]  41.11 55.54 0 top
CN6  PJ-320D  [AUDIO-SMD_PJ-320D]  50.75 55.54 0 top
CN7  PJ-320D  [AUDIO-SMD_PJ-320D]  60.38 55.54 0 top
CN8  PJ-320D  [AUDIO-SMD_PJ-320D]  70.01 55.54 0 top
CN9  PJ-320D  [AUDIO-SMD_PJ-320D]  79.65 55.51 0 top
CN10  PJ-320D  [AUDIO-SMD_PJ-320D]  89.28 55.77 0 top
CN11  PJ-320D  [AUDIO-SMD_PJ-320D]  89.28 9.41 180 top
CN12  PJ-320D  [AUDIO-SMD_PJ-320D]  79.65 9.41 180 top
CN13  PJ-320D  [AUDIO-SMD_PJ-320D]  70.01 9.41 180 top
CN14  PJ-320D  [AUDIO-SMD_PJ-320D]  60.38 9.41 180 top
CN15  PJ-320D  [AUDIO-SMD_PJ-320D]  50.75 9.41 180 top
CN16  PJ-320D  [AUDIO-SMD_PJ-320D]  41.11 9.41 180 top
CN17  PJ-320D  [AUDIO-SMD_PJ-320D]  31.48 9.41 180 top
CN18  PJ-320D  [AUDIO-SMD_PJ-320D]  21.84 9.41 180 top
D1  1N5819HW-7-F  [SOD-123_L2.7-W1.6-LS3.7-RD]  36.37 -30.68 0 top
D2  LESD5D5.0CT1G  [SOD-523_L1.2-W0.8-LS1.6-BI]  36.37 -34.4 0 top
D3  LESD5D5.0CT1G  [SOD-523_L1.2-W0.8-LS1.6-BI]  38.97 -34.4 0 top
D4  LESD5D5.0CT1G  [SOD-523_L1.2-W0.8-LS1.6-BI]  44.53 -34.4 0 top
D5  BAT760-7  [SOD-323_L1.8-W1.3-LS2.5-RD]  41.47 -38.07 0 top
D6  BZX84C6V8  [SOT-23_L2.9-W1.3-P1.90-LS2.4-BR]  26.67 -40.37 0 top
LED1  XL-5050RGBC-WS2812B  [LED-SMD_4P-L5.0-W5.0-BL_XL-5050RGBC]  18.42 25.92 180 top
Q2  BC817  [SOT-23-3_L2.9-W1.4-P1.91-LS2.6-BR]  32.44 -39.4 0 top
R1  470Ω  [R0402]  23.36 -36.19 0 top
R2  4.7kΩ  [R0402]  25.88 -19.9 0 top
R3  4.7kΩ  [R0402]  28.42 -19.9 0 top
R4  10kΩ  [R0402]  23.34 -14.95 0 top
R5  5.1kΩ  [R0402]  30.72 -43.56 0 top
R6  5.1kΩ  [R0402]  33.26 -43.56 0 top
R10  10kΩ  [R0402]  30.97 -29.08 0 top
R18  10kΩ  [R0603]  38.01 -15.45 0 top
R19  10kΩ  [R0603]  32.44 -35.37 0 top
RF1  HJ-SMA113  [SMA-TH_HJ-SMA113]  4.57 42.05 0 top
SW1  TSC017A07026A  [SW-TH_3P-L4.5-W7.0-P3.00-LS1.9]  42.42 -19.92 270 top
SW2  TSC017A07026A  [SW-TH_3P-L4.5-W7.0-P3.00-LS1.9]  42.42 -25.64 270 top
U3  RT9080-33GJ5  [TSOT-23-5_L2.9-W1.6-P0.95-LS2.8-BL]  44.01 -42.69 0 top
U4  ESP32-C6-MINI-1-N4  [WIFIM-SMD_61P-L16.6-W13.2-P0.80-ESP32-C6-MINI-1-N4]  11.05 58.05 90 top
U16  -  [Programming Pads]  26.92 43.32 180 bottom
U17  HLK-PM03  [PWRM-TH_HLK-PM03]  69.6 32.4 90 top
U18  MX235-5.0-04P-GY01-Cu-A  [CONN-TH_8P-P5.00_MAX_MX235-5.0-GY01-04P-CU-A]  87.25 32.53 90 top
USB1  TYPE-C16PIN2MD(073)  [USB-C-SMD_TYPE-C-6PIN-2MD-073]  7.75 5.22 0 top

## Footprints (pads in the part's own frame, mm; a bottom-side part is the same pattern mirrored in y, then rotated)
AUDIO-SMD_PJ-320D
  rect 3x1.4 smd: 1(-3,-4.05) 2(3,4.05) 3(3,1.05) 4(3,-2.95)
C0402
  rect 0.79x0.54 smd: 1(-0.545,0) 2(0.545,0)
CONN-TH_8P-P5.00_MAX_MX235-5.0-GY01-04P-CU-A
  rect 2.4x2.4 hole 1.4: 1(-7.5,-2.499)
  round 2.4 hole 1.4: 2(-7.5,2.5) 3(-2.5,-2.5) 4(-2.5,2.5) 5(2.5,-2.5) 6(2.5,2.5) 7(7.5,-2.5) 8(7.5,2.5)
KEY-SMD_4P-L6.0-W6.0-P4.50-LS9.5-BR
  rect 2.3x1.4 smd: 1(4.475,-2.25) 2(-4.475,-2.25) 3(4.475,2.25) 4(-4.475,2.25)
LED-SMD_4P-L5.0-W5.0-BL_XL-5050RGBC
  rect 1x1.5 smd: 1(-1.5,-2.5) 2(1.5,-2.5) 3(1.5,2.5) 4(-1.5,2.5)
Programming Pads
  round 2 smd: 1(0,0) 2(0,-2.546) 3(0,-5.092) 4(0,-7.638) 5(0,-10.184)
PWRM-TH_HLK-PM03
  round 2 hole 1.2: 1(-14.7,2.5) 2(-14.7,-2.5) 3(14.7,7.7) 4(14.7,-7.7)
R0402
  rect 0.566x0.54 smd: 1(-0.433,0) 2(0.433,0)
R0603
  rect 0.806x0.864 smd: 1(-0.753,0) 2(0.753,0)
SMA-TH_HJ-SMA113
  round 2.2 hole 1.5: 1(0,0)
  round 2.5 hole 1.7: 2(-2.55,2.55) 3(-2.55,-2.55) 4(2.55,-2.55) 5(2.55,2.55)
SOD-123_L2.7-W1.6-LS3.7-RD
  rect 0.91x1.22 smd: 1(-1.635,0) 2(1.635,0)
SOD-323_L1.8-W1.3-LS2.5-RD
  rect 1x0.75 smd: 1(-1.173,0) 2(1.173,0)
SOD-523_L1.2-W0.8-LS1.6-BI
  rect 0.6x0.6 smd: 1(-0.75,0) 2(0.75,0)
SOT-23-3_L2.9-W1.4-P1.91-LS2.6-BR
  rect 1.07x0.532 smd: 1(1.135,-0.955) 2(1.135,0.955) 3(-1.135,0)
SOT-23_L2.9-W1.3-P1.90-LS2.4-BR
  rect 1x0.8 smd: 1(1.15,-0.95) 2(1.15,0.95) 3(-1.15,0)
SW-TH_3P-L4.5-W7.0-P3.00-LS1.9
  round 1.7 hole 1.1: 1(-1.5,0.925) 2(1.5,0.925) 3(0,-0.925)
TSOT-23-5_L2.9-W1.6-P0.95-LS2.8-BL
  rect 0.532x1.045 smd: 1(-0.95,-1.147) 2(0,-1.147) 3(0.95,-1.147) 4(0.95,1.147) 5(-0.95,1.147)
USB-C-SMD_TYPE-C-6PIN-2MD-073
  rect 0.6x1.1 smd: 1(-3.2,2.375) 2(-2.4,2.375) 11(2.4,2.375) 12(3.2,2.375)
  rect 0.3x1.1 smd: 3(-1.75,2.375) 4(-1.25,2.375) 5(-0.75,2.375) 6(-0.25,2.375) 7(0.25,2.375) 8(0.75,2.375) 9(1.25,2.375) 10(1.75,2.375)
  oval 1.2x2 hole 0.6x1.5: 13(-4.325,1.825) 14(4.325,1.825)
  oval 1.2x1.8 hole 0.6x1.2: 13(-4.325,-2.375) 14(4.325,-2.375)
WIFIM-SMD_61P-L16.6-W13.2-P0.80-ESP32-C6-MINI-1-N4
  rect 0.8x0.4 smd: 1(-5.9,3.975) 2(-5.9,3.175) 3(-5.9,2.375) 4(-5.9,1.575) 5(-5.9,0.775) 6(-5.9,-0.025) 7(-5.9,-0.825) 8(-5.9,-1.625) 9(-5.9,-2.425) 10(-5.9,-3.225) 11(-5.9,-4.025) 25(5.9,-4.025) 26(5.9,-3.225) 27(5.9,-2.425) 28(5.9,-1.625) 29(5.9,-0.825) 30(5.9,-0.025) 31(5.9,0.775) 32(5.9,1.575) 33(5.9,2.375) 34(5.9,3.175) 35(5.9,3.975)
  rect 0.4x0.8 smd: 12(-4.8,-4.9) 13(-4,-4.9) 14(-3.2,-4.9) 15(-2.4,-4.9) 16(-1.6,-4.9) 17(-0.8,-4.9) 18(0,-4.9) 19(0.8,-4.9) 20(1.6,-4.9) 21(2.4,-4.9) 22(3.2,-4.9) 23(4,-4.9) 24(4.8,-4.9) 36(4.8,4.9) 37(4,4.9) 38(3.2,4.9) 39(2.4,4.9) 40(1.6,4.9) 41(0.8,4.9) 42(0,4.9) 43(-0.8,4.9) 44(-1.6,4.9) 45(-2.4,4.9) 46(-3.2,4.9) 47(-4,4.9) 48(-4.8,4.9)
  rect 1.45x1.45 smd: 49(-1.775,1.85) 49(-1.775,0.05) 49(-1.775,-1.75) 49(0.025,1.85) 49(0.025,0.05) 49(0.025,-1.75) 49(1.825,1.85) 49(1.825,0.05) 49(1.825,-1.75)
  rect 0.7x0.7 smd: 50(5.95,4.95) 51(5.95,-4.95) 52(-5.95,-4.95) 53(-5.95,4.95)

## Nets
As in the schematic.

Pads without a net: BT3 1 2 3 4; BT4 1 2 3 4; CN1 1 2 3 4; CN2 1 2 3 4; CN3 1 2 3 4; CN4 1 2 3 4; CN5 1 2 3 4; CN6 1 2 3 4; CN7 1 2 3 4; CN8 1 2 3 4; CN9 1 2 3 4; CN10 1 2 3 4; CN11 1 2 3 4; CN12 1 2 3 4; CN13 1 2 3 4; CN14 1 2 3 4; CN15 1 2 3 4; CN16 1 2 3 4; CN17 1 2 3 4; CN18 1 2 3 4; D6 2; LED1 2; RF1 1 2 3 4 5; U3 4; U4 4 7 21 32 33 34 35; U17 1 2 3 4; U18 1 2 3 4 5 6 7 8; USB1 3 9
